# Altium schematic sheet Top_Sheet.SchDoc
size A4; SheetNumber: 1; SheetTotal: 7
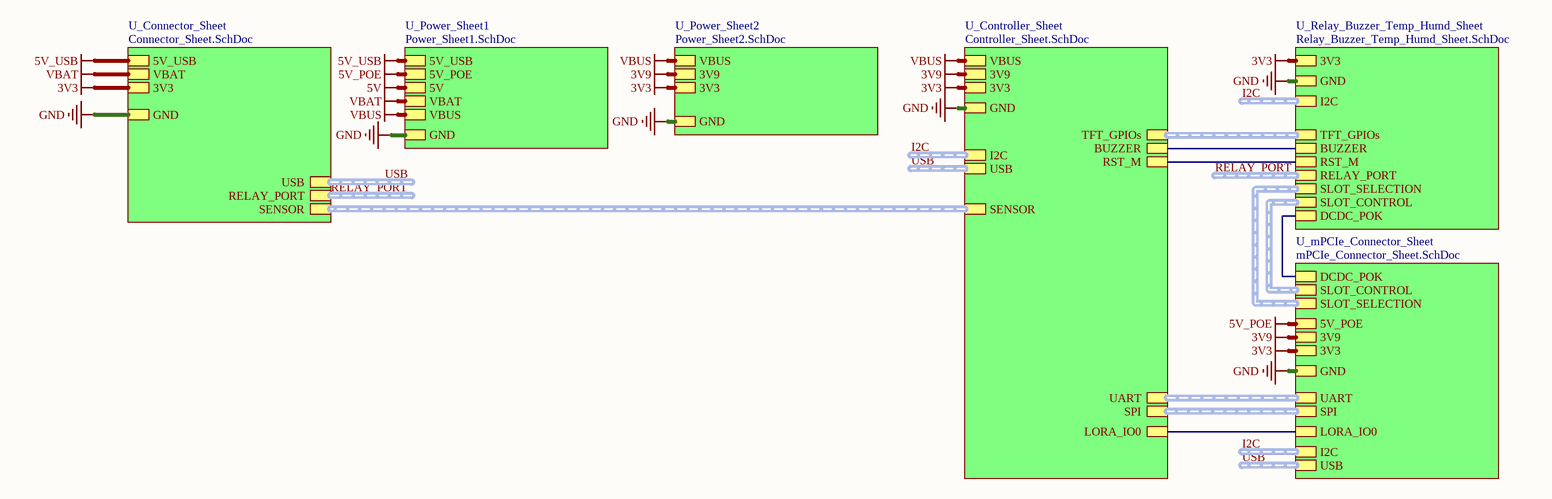
[diagram p0: Top_Sheet.SchDoc]

## Sub-sheets
U_Connector_Sheet = Connector_Sheet.SchDoc: 5V_USB, 3V3, RELAY_PORT (harness RELAY_PORT), GND, SENSOR (harness SENSOR), USB (harness USB), VBAT
U_Controller_Sheet = Controller_Sheet.SchDoc: GND, 3V3, 3V9, VBUS, LORA_IO0, UART (harness UART), SPI (harness SPI), I2C (harness I2C), SENSOR (harness SENSOR), RST_M, USB (harness USB), BUZZER, TFT_GPIOs (harness I2C)
U_mPCIe_Connector_Sheet = mPCIe_Connector_Sheet.SchDoc: DCDC_POK, 5V_POE, 3V3, 3V9, GND, USB (harness USB), LORA_IO0, SLOT_SELECTION (harness SLOT_SELECTION), SLOT_CONTROL (harness SLOT_CONTROL), UART (harness UART), SPI (harness SPI), I2C (harness I2C)
U_Power_Sheet1 = Power_Sheet1.SchDoc: GND, VBUS, 5V_USB, VBAT, 5V_POE, 5V
U_Power_Sheet2 = Power_Sheet2.SchDoc: VBUS, 3V9, 3V3, GND
U_Relay_Buzzer_Temp_Humd_Sheet = Relay_Buzzer_Temp_Humd_Sheet.SchDoc: RELAY_PORT (harness RELAY_PORT), 3V3, GND, BUZZER, DCDC_POK, RST_M, SLOT_SELECTION (harness SLOT_SELECTION), SLOT_CONTROL (harness SLOT_CONTROL), I2C (harness I2C), TFT_GPIOs (harness I2C)

## Nets
3V3: sheet U_Connector_Sheet/3V3, sheet U_Power_Sheet2/3V3, sheet U_mPCIe_Connector_Sheet/3V3, sheet U_Relay_Buzzer_Temp_Humd_Sheet/3V3, sheet U_Controller_Sheet/3V3
3V9: sheet U_Power_Sheet2/3V9, sheet U_mPCIe_Connector_Sheet/3V9, sheet U_Controller_Sheet/3V9
5V: sheet U_Power_Sheet1/5V
5V_POE: sheet U_Power_Sheet1/5V_POE, sheet U_mPCIe_Connector_Sheet/5V_POE
5V_USB: sheet U_Connector_Sheet/5V_USB, sheet U_Power_Sheet1/5V_USB
GND: sheet U_Connector_Sheet/GND, sheet U_Power_Sheet1/GND, sheet U_Power_Sheet2/GND, sheet U_mPCIe_Connector_Sheet/GND, sheet U_Relay_Buzzer_Temp_Humd_Sheet/GND, sheet U_Controller_Sheet/GND
VBAT: sheet U_Connector_Sheet/VBAT, sheet U_Power_Sheet1/VBAT
VBUS: sheet U_Power_Sheet1/VBUS, sheet U_Power_Sheet2/VBUS, sheet U_Controller_Sheet/VBUS
(unnamed): sheet U_mPCIe_Connector_Sheet/DCDC_POK, sheet U_Relay_Buzzer_Temp_Humd_Sheet/DCDC_POK
(unnamed): sheet U_mPCIe_Connector_Sheet/LORA_IO0, sheet U_Controller_Sheet/LORA_IO0
(unnamed): sheet U_Relay_Buzzer_Temp_Humd_Sheet/BUZZER, sheet U_Controller_Sheet/BUZZER
(unnamed): sheet U_Relay_Buzzer_Temp_Humd_Sheet/RST_M, sheet U_Controller_Sheet/RST_M

## Buses and harness runs
harness I2C = sheet U_Controller_Sheet/I2C
harness I2C = sheet U_mPCIe_Connector_Sheet/I2C
harness I2C = sheet U_Relay_Buzzer_Temp_Humd_Sheet/I2C
harness RELAY_PORT = sheet U_Connector_Sheet/RELAY_PORT
harness RELAY_PORT = sheet U_Relay_Buzzer_Temp_Humd_Sheet/RELAY_PORT
harness sheet U_Connector_Sheet/SENSOR = sheet U_Controller_Sheet/SENSOR
harness sheet U_Controller_Sheet/SPI = sheet U_mPCIe_Connector_Sheet/SPI
harness sheet U_Controller_Sheet/TFT_GPIOs = sheet U_Relay_Buzzer_Temp_Humd_Sheet/TFT_GPIOs
harness sheet U_Controller_Sheet/UART = sheet U_mPCIe_Connector_Sheet/UART
harness sheet U_mPCIe_Connector_Sheet/SLOT_CONTROL = sheet U_Relay_Buzzer_Temp_Humd_Sheet/SLOT_CONTROL
harness sheet U_mPCIe_Connector_Sheet/SLOT_SELECTION = sheet U_Relay_Buzzer_Temp_Humd_Sheet/SLOT_SELECTION
harness USB = sheet U_Connector_Sheet/USB
harness USB = sheet U_Controller_Sheet/USB
harness USB = sheet U_mPCIe_Connector_Sheet/USB

## Notes on the sheet
- File:
- Title:
- Date:
- Page
- Num:
- Total:
- Drawn By: Huzaifa Ali